# Altium schematic sheet 07-Antena_Manager.SchDoc: Antena Manager
size A4; Organization: ORGANIZATION; Address1: ADDRESS 1; Address2: ADDRESS 2; Address3: ADDRESS 3; Address4: ADDRESS 4; SheetNumber: 7; SheetTotal: 7; ENG_APP_DATE: --/--/--; DSN_APP_DATE: --/--/--; CHK_APP_DATE: --/--/--
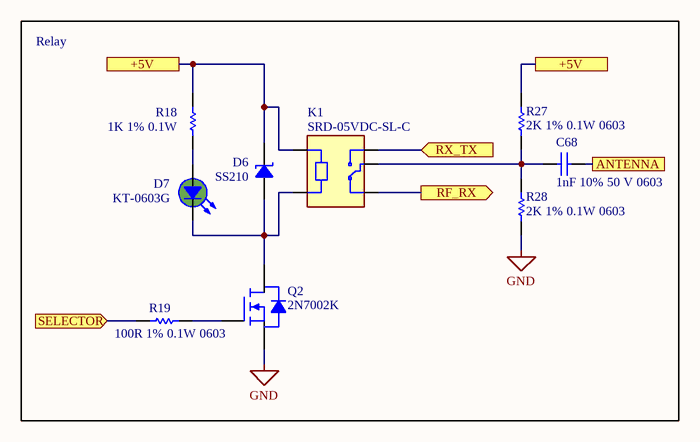
[diagram p0: 07-Antena_Manager.SchDoc]

## Parts
C68  1nF 10% 50 V 0603  [CAPC1608X90X40NL10T20]
D6  SS210  [DO214AC(SMA)]
D7  KT-0603G  [LED-0603-RED]
K1  SRD-05VDC-SL-C  [RELAY_SRD-05VDC-SL-C]
Q2  2N7002K  [FP-318-08-IPC_B]
R18  1K 1% 0.1W  [R0603]
R19  100R 1% 0.1W 0603  [R0603]
R27  2K 1% 0.1W 0603  [R0603]
R28  2K 1% 0.1W 0603  [R0603]

## Blocks framed on the sheet
Relay: C68 D6 D7 K1 Q2 R18 R19 R27 R28

## Ports
+5V, ANTENNA, RF_RX (out), RX_TX (in), SELECTOR (in)

## Nets
GND: Q2.2(S) R28.1
+5V: D6.2 K1.A1 R18.1 R27.2 ; port +5V
ANTENNA: C68.1 ; port ANTENNA
RF_RX: K1.NC ; port RF_RX
RX_TX: K1.NO ; port RX_TX
SELECTOR: R19.1 ; port SELECTOR
NetC68_2: C68.2 K1.COM R27.1 R28.2
NetD6_1: D6.1 D7.2 K1.A2 Q2.3(D)
NetD7_1: D7.1 R18.2
NetQ2_1: Q2.1(G) R19.2

## Notes on the sheet
- Revision
- Project
- Author
- Page Title

## Library data of the parts
C68 = CMP-001-00203-2: Chip Capacitor, 1 nF, 10%, 50 V, 0603 (1608 Metric); MFR_Part_#: CL10B102KB8NNNC; Capacitor Type: Ceramic; Voltage Rating: 50V; LCSC_Price_1ku: 0.0020; Pins: 2; Case/Package: 0603; Min Operating Temperature: -55°C; Mounting Technology: SM; Value: 1nF; Max Operating Temperature: 125°C; RoHS Compliant: True; LCSC_Part_#: C1588; Tolerance: 10%
D6 = CMP-004-00073-2: Schottky Diode, 2A, 100V, Smb; MFR_Part_#: SS210; LCSC_Part_#: C14996; LCSC_Price_1ku: 0.0124
D7 = CMP-007-00044-3: 0603 Green LED; MFR_Part_#: KT-0603G; LCSC_Price_1ku: 0.0068; LCSC_Part_#: C12624
K1 = CMP-499-000000-2: 5V Trigger Relay Module For Arduino And Raspberry Pi 5V Trigger Relay Module For Arduino And Raspberry Pi; MFR_Part_#: SRD-05VDC-SL-C; LCSC_Price_1ku: 0.18; LCSC_Part_#: C35449
Q2 = CMP-013-00042-1: Mosfet N-ch 60V 300MA SOT23 / Trans Mosfet N-ch 60V 0.3A 3-PIN SOT-23 T/r; MFR_Part_#: 2N7002K; LCSC_Part_#: C5247922; LCSC_Price_1ku: 0.00119
R18 = CMP-009-00312-2: Standard Resistor 1K 1% 0.1W 0603; MFR_Part_#: 0603WAF1001T5E; Manufacturer: Generic; TC: 200; Tolerance: 1%; LCSC_Part_#: C21190; Value: 1K; LCSC_Price_1ku: 0.0007; Power: 0.1W; Pin Count: 2; PartNumber: 1K 1% 0.1W 0603; Design Item ID: 1K 1% 0.1W 0603; Component Type: Standard; Source: GT_WH_Control.SCHLIB
R19 = CMP-009-00305-3: Standard Resistor 100R 1% 0.1W 0603; Manufacturer: Generic; MFR_Part_#: 0603WAF1000T5E; TC: 200; PartNumber: 100R 1% 0.1W 0603; LCSC_Part_#: C22775; Pin Count: 2; Design Item ID: 100R 1% 0.1W 0603; Component Type: Standard; Tolerance: 1%; Value: 100R; Source: GT_WH_Control.SCHLIB; Power: 0.1W; LCSC_Price_1ku: 0.0008
R27 R28 = CMP-009-00329-2: Standard Resistor 2K 1% 0.1W 0603; MFR_Part_#: 0603WAF2001T5E; Manufacturer: Generic; TC: 200; PartNumber: 2K 1% 0.1W 0603; LCSC_Price_1ku: 0.0007; LCSC_Part_#: C22975; Pin Count: 2; Source: GT_WH_Control.SCHLIB; Value: 2K; Component Type: Standard; Design Item ID: 2K 1% 0.1W 0603; Power: 0.1W; Tolerance: 1%